# Altium schematic sheet DDR.SchDoc
size A4; SheetNumber: 3; SheetTotal: 3
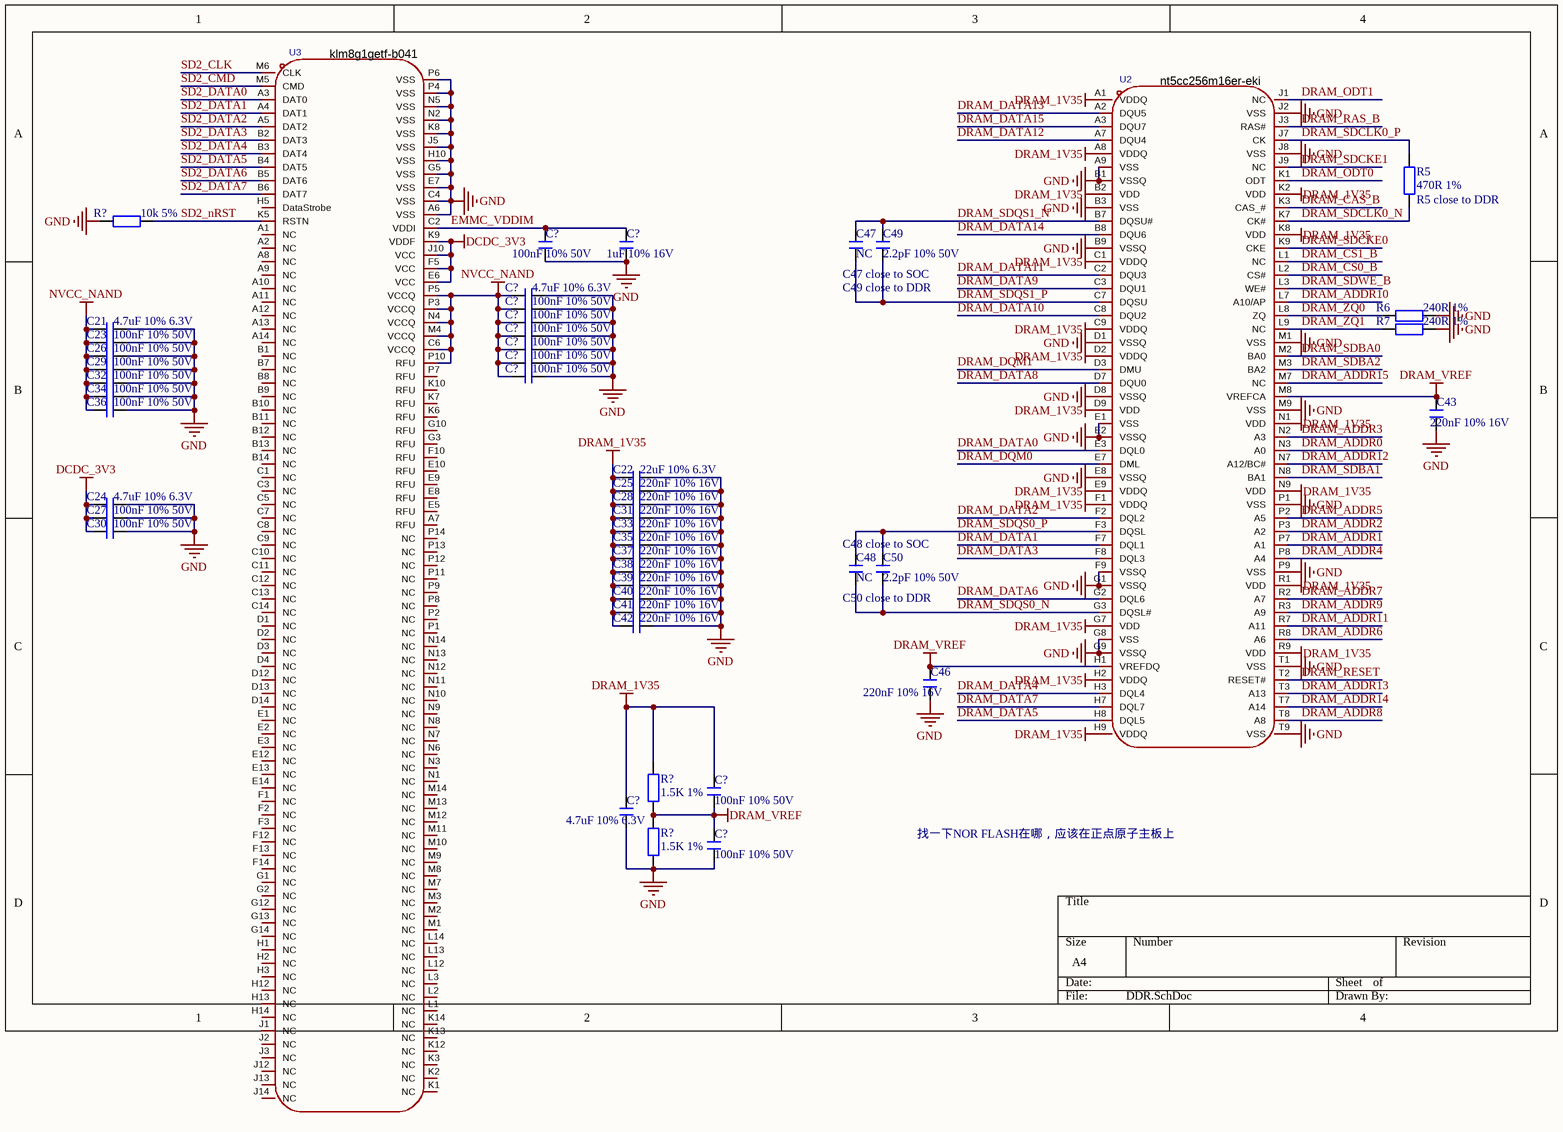
[diagram p0: DDR.SchDoc]

## Parts
(Parts that share a designator on the sheet are numbered #1, #2 ... from top to bottom, then left to right.)
C21  4.7uF 10% 6.3V  [C0603_L]
C22  22uF 10% 6.3V  [C0603_L]
C23  100nF 10% 50V  [C0603_L]
C24  4.7uF 10% 6.3V  [C0603_L]
C25  220nF 10% 16V  [C0603_L]
C26  100nF 10% 50V  [C0603_L]
C27  100nF 10% 50V  [C0603_L]
C28  220nF 10% 16V  [C0603_L]
C29  100nF 10% 50V  [C0603_L]
C30  100nF 10% 50V  [C0603_L]
C31  220nF 10% 16V  [C0603_L]
C32  100nF 10% 50V  [C0603_L]
C33  220nF 10% 16V  [C0603_L]
C34  100nF 10% 50V  [C0603_L]
C35  220nF 10% 16V  [C0603_L]
C36  100nF 10% 50V  [C0603_L]
C37  220nF 10% 16V  [C0603_L]
C38  220nF 10% 16V  [C0603_L]
C39  220nF 10% 16V  [C0603_L]
C40  220nF 10% 16V  [C0603_L]
C41  220nF 10% 16V  [C0603_L]
C42  220nF 10% 16V  [C0603_L]
C43  220nF 10% 16V  [C0603_L]
C46  220nF 10% 16V  [C0603_L]
C47  NC  [C0603_L]
C48  NC  [C0603_L]
C49  2.2pF 10% 50V  [C0603_L]
C50  2.2pF 10% 50V  [C0603_L]
C?#1  1uF 10% 16V  [C0603_L]
C?#2  100nF 10% 50V  [C0603_L]
C?#3  4.7uF 10% 6.3V  [C0603_L]
C?#4  100nF 10% 50V  [C0603_L]
C?#5  100nF 10% 50V  [C0603_L]
C?#6  100nF 10% 50V  [C0603_L]
C?#7  100nF 10% 50V  [C0603_L]
C?#8  100nF 10% 50V  [C0603_L]
C?#9  100nF 10% 50V  [C0603_L]
C?#10  100nF 10% 50V  [C0603_L]
C?#11  4.7uF 10% 6.3V  [C0603_L]
C?#12  100nF 10% 50V  [C0603_L]
R5  470R 1%  [R0603_L]
R6  240R 1%  [R0603_L]
R7  240R 1%  [R0603_L]
R?#1  10k 5%  [R0603_L]
R?#2  1.5K 1%  [R0603_L]
R?#3  1.5K 1%  [R0603_L]
U2  nt5cc256m16er-eki  [TFBGA-96_L13.0-W8.0-R16-C6-P0.80-TL]
U3  klm8g1getf-b041  [FBGA-153_L13.0-W11.5-P0.50_KLMAG1JETD-B041]

## Nets
DCDC_3V3: C24.1 C27.1 C30.1 U3.E6(VCC) U3.F5(VCC) U3.J10(VCC) U3.K9(VDDF)
DRAM_1V35: C22.1 C25.1 C28.1 C31.1 C33.1 C35.1 C37.1 C38.1 C39.1 C40.1 C41.1 C42.1 C?#10.2 C?#11.2 R?#2.2 U2.A1(VDDQ) U2.A8(VDDQ) U2.B2(VDD) U2.C1(VDDQ) U2.C9(VDDQ) U2.D2(VDDQ) U2.D9(VDD) U2.E9(VDDQ) U2.F1(VDDQ) U2.G7(VDD) U2.H2(VDDQ) U2.H9(VDDQ) U2.K2(VDD) U2.K8(VDD) U2.N1(VDD) U2.N9(VDD) U2.R1(VDD) U2.R9(VDD)
DRAM_VREF: C43.2 C46.2 C?#10.1 C?#12.2 R?#2.1 R?#3.2 U2.H1(VREFDQ) U2.M8(VREFCA)
GND: C21.2 C22.2 C23.2 C24.2 C25.2 C26.2 C27.2 C28.2 C29.2 C30.2 C31.2 C32.2 C33.2 C34.2 C35.2 C36.2 C37.2 C38.2 C39.2 C40.2 C41.2 C42.2 C43.1 C46.1 C?#1.2 C?#2.1 C?#3.2 C?#4.1 C?#5.1 C?#6.1 C?#7.1 C?#8.1 C?#9.1 C?#11.1 C?#12.1 R6.2 R7.2 R?#1.1 R?#3.1 U2.A9(VSS) U2.B1(VSSQ) U2.B3(VSS) U2.B9(VSSQ) U2.D1(VSSQ) U2.D8(VSSQ) U2.E1(VSS) U2.E2(VSSQ) U2.E8(VSSQ) U2.F9(VSSQ) U2.G1(VSSQ) U2.G8(VSS) U2.G9(VSSQ) U2.J2(VSS) U2.J8(VSS) U2.M1(VSS) U2.M9(VSS) U2.P1(VSS) U2.P9(VSS) U2.T1(VSS) U2.T9(VSS) U3.A6(VSS) U3.C4(VSS) U3.E7(VSS) U3.G5(VSS) U3.H10(VSS) U3.J5(VSS) U3.K8(VSS) U3.N2(VSS) U3.N5(VSS) U3.P4(VSS) U3.P6(VSS)
NVCC_NAND: C21.1 C23.1 C26.1 C29.1 C32.1 C34.1 C36.1 C?#3.1 C?#4.2 C?#5.2 C?#6.2 C?#7.2 C?#8.2 C?#9.2 U3.C6(VCCQ) U3.M4(VCCQ) U3.N4(VCCQ) U3.P3(VCCQ) U3.P5(VCCQ) U3.P10(RFU)
DRAM_ADDR0: U2.N3(A0)
DRAM_ADDR1: U2.P7(A1)
DRAM_ADDR2: U2.P3(A2)
DRAM_ADDR3: U2.N2(A3)
DRAM_ADDR4: U2.P8(A4)
DRAM_ADDR5: U2.P2(A5)
DRAM_ADDR6: U2.R8(A6)
DRAM_ADDR7: U2.R2(A7)
DRAM_ADDR8: U2.T8(A8)
DRAM_ADDR9: U2.R3(A9)
DRAM_ADDR10: U2.L7(A10/AP)
DRAM_ADDR11: U2.R7(A11)
DRAM_ADDR12: U2.N7(A12/BC#)
DRAM_ADDR13: U2.T3(A13)
DRAM_ADDR14: U2.T7(A14)
DRAM_ADDR15: U2.M7(NC)
DRAM_CAS_B: U2.K3(CAS_#)
DRAM_CS0_B: U2.L2(CS#)
DRAM_CS1_B: U2.L1(NC)
DRAM_DATA0: U2.E3(DQL0)
DRAM_DATA1: U2.F7(DQL1)
DRAM_DATA2: U2.F2(DQL2)
DRAM_DATA3: U2.F8(DQL3)
DRAM_DATA4: U2.H3(DQL4)
DRAM_DATA5: U2.H8(DQL5)
DRAM_DATA6: U2.G2(DQL6)
DRAM_DATA7: U2.H7(DQL7)
DRAM_DATA8: U2.D7(DQU0)
DRAM_DATA9: U2.C3(DQU1)
DRAM_DATA10: U2.C8(DQU2)
DRAM_DATA11: U2.C2(DQU3)
DRAM_DATA12: U2.A7(DQU4)
DRAM_DATA13: U2.A2(DQU5)
DRAM_DATA14: U2.B8(DQU6)
DRAM_DATA15: U2.A3(DQU7)
DRAM_DQM0: U2.E7(DML)
DRAM_DQM1: U2.D3(DMU)
DRAM_ODT0: U2.K1(ODT)
DRAM_ODT1: U2.J1(NC)
DRAM_RAS_B: U2.J3(RAS#)
DRAM_RESET: U2.T2(RESET#)
DRAM_SDBA0: U2.M2(BA0)
DRAM_SDBA1: U2.N8(BA1)
DRAM_SDBA2: U2.M3(BA2)
DRAM_SDCKE0: U2.K9(CKE)
DRAM_SDCKE1: U2.J9(NC)
DRAM_SDCLK0_N: R5.2 U2.K7(CK#)
DRAM_SDCLK0_P: R5.1 U2.J7(CK)
DRAM_SDQS0_N: C48.1 C50.1 U2.G3(DQSL#)
DRAM_SDQS0_P: C48.2 C50.2 U2.F3(DQSL)
DRAM_SDQS1_N: C47.2 C49.2 U2.B7(DQSU#)
DRAM_SDQS1_P: C47.1 C49.1 U2.C7(DQSU)
DRAM_SDWE_B: U2.L3(WE#)
DRAM_ZQ0: R6.1 U2.L8(ZQ)
DRAM_ZQ1: R7.1 U2.L9(NC)
EMMC_VDDIM: C?#1.1 C?#2.2 U3.C2(VDDI)
SD2_CLK: U3.M6(CLK)
SD2_CMD: U3.M5(CMD)
SD2_DATA0: U3.A3(DAT0)
SD2_DATA1: U3.A4(DAT1)
SD2_DATA2: U3.A5(DAT2)
SD2_DATA3: U3.B2(DAT3)
SD2_DATA4: U3.B3(DAT4)
SD2_DATA5: U3.B4(DAT5)
SD2_DATA6: U3.B5(DAT6)
SD2_DATA7: U3.B6(DAT7)
SD2_nRST: R?#1.2 U3.K5(RSTN)

Not connected (* = marked no-connect by the designer): U3 A1(NC) A2(NC) A7(RFU) A8(NC) A9(NC) A10(NC) A11(NC) A12(NC) A13(NC) A14(NC) B1(NC) B7(NC) B8(NC) B9(NC) B10(NC) B11(NC) B12(NC) B13(NC) B14(NC) C1(NC) C3(NC) C5(NC) C7(NC) C8(NC) C9(NC) C10(NC) C11(NC) C12(NC) C13(NC) C14(NC) D1(NC) D2(NC) D3(NC) D4(NC) D12(NC) D13(NC) D14(NC) E1(NC) E2(NC) E3(NC) E5(RFU) E8(RFU) E9(RFU) E10(RFU) E12(NC) E13(NC) E14(NC) F1(NC) F2(NC) F3(NC) F10(RFU) F12(NC) F13(NC) F14(NC) G1(NC) G2(NC) G3(RFU) G10(RFU) G12(NC) G13(NC) G14(NC) H1(NC) H2(NC) H3(NC) H5(DataStrobe) H12(NC) H13(NC) H14(NC) J1(NC) J2(NC) J3(NC) J12(NC) J13(NC) J14(NC) K1(NC) K2(NC) K3(NC) K6(RFU) K7(RFU) K10(RFU) K12(NC) K13(NC) K14(NC) L1(NC) L2(NC) L3(NC) L12(NC) L13(NC) L14(NC) M1(NC) M2(NC) M3(NC) M7(NC) M8(NC) M9(NC) M10(NC) M11(NC) M12(NC) M13(NC) M14(NC) N1(NC) N3(NC) N6(NC) N7(NC) N8(NC) N9(NC) N10(NC) N11(NC) N12(NC) N13(NC) N14(NC) P1(NC) P2(NC) P7(RFU) P8(NC) P9(NC) P11(NC) P12(NC) P13(NC) P14(NC)

## Notes on the sheet
- (near R5) R5 close to DDR
- C47 close to SOC
- C49 close to DDR
- C48 close to SOC
- C50 close to DDR
- 找一下NOR FLASH在哪，应该在正点原子主板上

## Library data of the parts
C21-C43 C46-C50 C?#1-C?#12 = C: 贴片电容; BOM名称: 无极性贴片电容; 优秀评价可免费更新: 联系淘宝ID：黄晶宝石，获取更新版封装库; 卖家免费技术支持，联系售后: 唯一出售店铺网址https://shop463601444.taobao.com; 本封装库来自淘宝卖家 ID：黄晶宝石: 其他店铺购入均为盗版，请立即申请退款
R5-R7 R?#1-R?#3 = R: 贴片电阻; 优秀评价可免费更新: 联系淘宝ID：黄晶宝石，获取更新版封装库; 卖家免费技术支持，联系售后: 唯一出售店铺网址https://shop463601444.taobao.com; 本封装库来自淘宝卖家 ID：黄晶宝石: 其他店铺购入均为盗版，请立即申请退款; BOM名称: 贴片电阻
U2 = nt5cc256m16er-eki: 存储器构架(格式):DDR3L SDRAM;时钟频率(fc):933MHz;存储容量:4Gbit;; Manufacturer: Nanya(南亚科技); AddInBom: yes; ModelId: 0ec929e740a041138b079053a12b9d40; ModelName: TFBGA-96_L13.0-W8.0-H1.1-R16-C6-P0.80-TL; ModelTransform: 314.96,511.81,0,0,0,0,0.004,0.004,0; Clock Frequency: 933MHz; Memory Size: 4Gbit; Voltage - Supply: 1.5V；1.35V; Symbol: NT5CC256M16ER-EKI; LCSC Part Name: 商用和工业用DDR3(L) 4Gb SDRAM; SupplierPart: C2841153; ManufacturerPart: NT5CC256M16ER-EKI; Supplier Footprint: TFBGA-96; JLCPCB Part Class: Extended Part; Datasheet: https://item.szlcsc.com/datasheet/NT5CC256M16ER-EKI/3022849.html; Supplier: LCSC; ConvertToPcb: yes; FootprintName: TFBGA-96_L13.0-W8.0-R16-C6-P0.80-TL; Memory Format: DDR3L SDRAM; Current - Supply: -; Refresh Current: -; Operating Temperature: -40℃~+95℃; Features: 写入均衡功能；自动自刷新；自动预充电功能；ZQ校准功能；异步复位功能；动态片上端接
U3 = klm8g1getf-b041: NAND闪存类型:-;协议版本:eMMC 5.1;存储容量:8GB;; Manufacturer: SAMSUNG(三星半导体); AddInBom: yes; ModelId: e295469cf8df408b9f13391ad06a16e8; ModelName: FBGA-153_L13.0-W11.5-H1.1-P0.50_KLMAG1JETD-B041; ModelTransform: 452.755,511.81,0,0,0,0,0,0,0; Memory Size: 8GB; Reading Speed in Sequence: 330MB/S; Writing Speed in Sequence: 50MB/S; NAND Operating Voltage (VCCF): 2.7V~3.6V; Controller Operating Voltage (VCCQ): 2.7V~3.6V；1.7V~1.95V; Symbol: KLM8G1GETF-B041; LCSC Part Name: 嵌入式多媒体卡解决方案，采用BGA封装，兼容eMMC 5.1协议，支持HS400模式; SupplierPart: C499918; ManufacturerPart: KLM8G1GETF-B041; Supplier Footprint: FBGA-153(11.5x13); JLCPCB Part Class: Extended Part; Datasheet: https://item.szlcsc.com/datasheet/KLM8G1GETF-B041/512098.html; Supplier: LCSC; ConvertToPcb: yes; FootprintName: FBGA-153_L13.0-W11.5-P0.50_KLMAG1JETD-B041; NAND Flash Type: -; Protocol Version: eMMC 5.1; Operating Temperature: -25℃~+85℃; NAND Stand-By Current: -; Controller Stand-By Current: -; Features: 硬件复位功能；ECC纠错功能；内置磨损均衡功能；坏块管理功能；安全写保护功能